# Altium schematic sheet Main_Sheet.SchDoc
size 420 x 297 mm; SheetNumber: 1; SheetTotal: 1
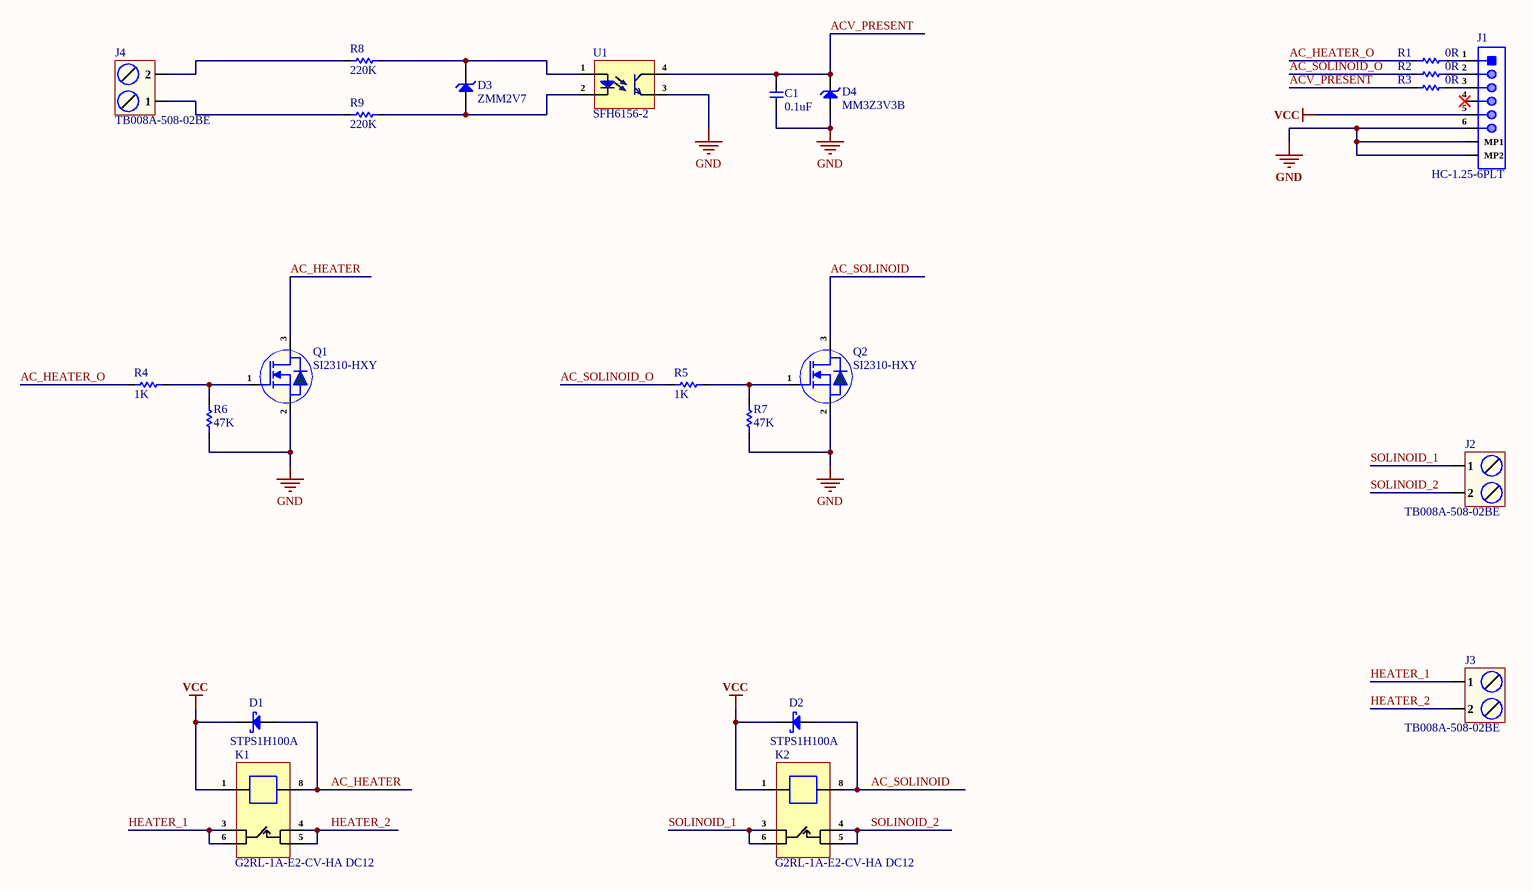
[diagram p0: Main_Sheet.SchDoc]

## Parts
C1  0.1uF  [Cap-0402]
D1  STPS1H100A  [SMA]
D2  STPS1H100A  [SMA]
D3  ZMM2V7  [LL-34]
D4  MM3Z3V3B  [SOD323F]
J1  HC-1.25-6PLT  [HC-1.25-6PLT]
J2  TB008A-508-02BE  [TB008A-508-02BE]
J3  TB008A-508-02BE  [TB008A-508-02BE]
J4  TB008A-508-02BE  [TB008A-508-02BE]
K1  G2RL-1A-E2-CV-HA DC12  [G2RL-1A-E2-CV-HA DC12]
K2  G2RL-1A-E2-CV-HA DC12  [G2RL-1A-E2-CV-HA DC12]
Q1  SI2310-HXY  [SOT-23]
Q2  SI2310-HXY  [SOT-23]
R1  0R  [Res-0603]
R2  0R  [Res-0603]
R3  0R  [Res-0603]
R4  1K  [Res-0402]
R5  1K  [Res-0402]
R6  47K  [Res-0402]
R7  47K  [Res-0402]
R8  220K  [Res-0603]
R9  220K  [Res-0603]
U1  SFH6156-2  [SFH6156-2]

## Nets
GND: C1.1 D4.1(A) J1.6 J1.MP1 J1.MP2 Q1.2(S) Q2.2(S) R6.1 R7.1 U1.3(E)
VCC: D1.1(K) D2.1(K) J1.5 K1.1 K2.1
AC_HEATER: D1.2(A) K1.8 Q1.3(D)
AC_HEATER_O: R1.1 R4.1
AC_SOLINOID: D2.2(A) K2.8 Q2.3(D)
AC_SOLINOID_O: R2.1 R5.1
ACV_PRESENT: C1.2 D4.2(K) R3.1 U1.4(C)
HEATER_1: J3.1 K1.3 K1.6
HEATER_2: J3.2 K1.4 K1.5
SOLINOID_1: J2.1 K2.3 K2.6
SOLINOID_2: J2.2 K2.4 K2.5
NetD3_1: D3.1(K) R8.2 U1.1(An)
NetD3_2: D3.2(A) R9.2 U1.2(Ca)
NetJ1_1: J1.1 R1.2
NetJ1_2: J1.2 R2.2
NetJ1_3: J1.3 R3.2
NetJ4_1: J4.1 R9.1
NetJ4_2: J4.2 R8.1
NetQ1_1: Q1.1(G) R4.2 R6.2
NetQ2_1: Q2.1(G) R5.2 R7.2

Not connected (* = marked no-connect by the designer): J1 4*

## Notes on the sheet
- File:
- Title:
- Date:
- Page
- Num:
- Total:
- Drawn By: Huzaifa Ali

## Library data of the parts
C1 = C1005X5R1H104K050BB: CAP CER 0.1UF 50V X5R 0402; Manufacturer: TDK; Capacitance: 100nF; Tolerance: 10%; Dielectric Material: Ceramic; Item Type: Capacitor; Supplier 1: Digi-Key; Manufacturer Part Number: C1005X5R1H104K050BB; Stock 1: 1455182; Pricing 1: 1=0.12, 10=0.09, 50=0.049, 100=0.04, 500=0.02858, 1000=0.02245, 2500=0.02041, 5000=0.01878 (USD); Mount: Surface Mount; Case/Package: 0402; Case Code (Metric): 1005; Case Code (Imperial): 0402; Min Operating Temperature: -55°C; Max Operating Temperature: 85°C; Dielectric: X5R; Voltage Rating: 50V; Package Quantity: 1; Packaging: Tape and Reel; Voltage Rating (DC): 50V; Termination: SMD/SMT; Length: 1mm; Height: 0.5mm; Width: 0.02inch; Thickness: 0.022inch; ComponentLink1URL: https://product.tdk.com/info/en/catalog/spec/mlccspec_commercial_general_midvoltage_en.pdf?src-supplier=Digi-Key; ComponentLink1Description: https://product.tdk.com/info/en/catalog/spec/mlccspec_commercial_general_midvoltage_en.pdf?src-supplier=Digi-Key; ComponentLink2URL: http://www.tdk.co.jp/tefe02/e413_c.pdf?src-supplier=Future+Electronics; ComponentLink2Description: http://www.tdk.co.jp/tefe02/e413_c.pdf?src-supplier=Future+Electronics; ComponentLink3URL: https://www.verical.com/server-webapp/html/getDatasheet?partID=743571&src-supplier=Verical; ComponentLink3Description: https://www.verical.com/server-webapp/html/getDatasheet?partID=743571&src-supplier=Verical; Supplier Part Number 1: 445-5942-1-ND; Weight: 2.3E-05oz; RoHS Compliant: Yes; Construction: Flat; Resistor Type: Ceramic; Voltage: 50V; Series: C; Depth: 0.5mm; Radiation Hardening: No; Lead Free: Lead Free; REACH SVHC: No SVHC; ComponentLink4URL: http://www.tdk.co.jp/tefe02/e412_c.pdf?src-supplier=Avnet+Europe; ComponentLink4Description: http://www.tdk.co.jp/tefe02/e412_c.pdf?src-supplier=Avnet+Europe; LCSC Part Number: C2181865
D1 D2 = STPS1H100A: DIODE SCHOTTKY 100V 1A SMA; Manufacturer: STMicroelectronics; Item Type: Diodes; Max Reverse Current: 4uA; Peak Non-Repetitive Surge Current: 50A; Forward Voltage: 860mV; Polarity: Standard; Supplier: Mouser; LCSC Part Number: C165701; Manufacturer Part Number: STPS1H100A; RoHS: Yes; Stock: 7367; Pricing: 1=0.34, 10=0.222, 50=0.222, 100=0.12, 1000=0.099, 10000=0.064 (USD); Mounting Technology: Surface Mount; Case/Package: SMA; Pins: 2; Min Operating Temperature: -65°C; Max Operating Temperature: 175°C; Max Repetitive Reverse Voltage (Vrrm): 100V; Forward Current: 1A; Packaging: Tape and Reel; Average Rectified Current: 1A; Series: -; Max Surge Current: 50A; Package Quantity: 5000; Max Reverse Leakage Current: 4uA; Max Forward Surge Current (Ifsm): 50A; Termination: SMD/SMT; Voltage Rating (DC): 100V; Output Current: 1A; Current Rating: 1A; Max Reverse Voltage (DC): 100V; Length: 4.6mm; Width: 2.95mm; Height: 2.03mm; Radiation Hardening: No; RoHS Compliant: Yes; Reach SVHC Compliant: No; Lead Free: Lead Free; ComponentLink1URL: https://datasheet.ciiva.com/14167/cd00001304-14167861.pdf?src-supplier=Distrelec; ComponentLink1Description: https://datasheet.ciiva.com/14167/cd00001304-14167861.pdf?src-supplier=Distrelec; ComponentLink2URL: https://datasheet.ciiva.com/915/cd00001304-915848.pdf?src-supplier=Digikey; ComponentLink2Description: https://datasheet.ciiva.com/915/cd00001304-915848.pdf?src-supplier=Digikey; ComponentLink3URL: https://datasheet.ciiva.com/7964/1690209-7964154.pdf?src-supplier=Element14; ComponentLink3Description: https://datasheet.ciiva.com/7964/1690209-7964154.pdf?src-supplier=Element14; ComponentLink4URL: https://datasheet.ciiva.com/915/cd00001304-915847.pdf?src-supplier=Digikey; ComponentLink4Description: https://datasheet.ciiva.com/915/cd00001304-915847.pdf?src-supplier=Digikey; ComponentLink5URL: https://datasheet.ciiva.com/915/cd00001304-915846.pdf?src-supplier=Digikey; ComponentLink5Description: https://datasheet.ciiva.com/915/cd00001304-915846.pdf?src-supplier=Digikey
D3 = ZMM2V7: Independent Type 2.5V~2.9V 500mW 2.7V LL-34 Zener Diodes ROHS; Manufacturer: HXY MOSFET; Item Type: Diode; Manufacturer Part Number: ZMM2V7; Package: LL-34; LCSC Part Number: C2891738; ComponentLink1Description: LCSC; ComponentLink1URL: https://www.lcsc.com/product-detail/Zener-Diodes_YONGYUTAI-ZMM2V7_C2891738.html
D4 = MM3Z3V3B: DIODE ZENER 3.3V 200MW SOD323F; Manufacturer: ON Semiconductor / Fairchild; Forward Voltage: 1V; Tolerance: 2%; Impedance: 89R; Max Reverse Leakage Current: 4.5uA; Test Current: 5mA; Element Configuration: Single; Supplier 1: Digi-Key; Manufacturer Part Number: MM3Z3V3B; Stock 1: 473644; Pricing 1: 1=0.22, 10=0.18, 100=0.0956, 500=0.06288, 1000=0.04276 (USD); Mount: Surface Mount; Number of Pins: 2; Weight: 0.0276g; Min Operating Temperature: -65°C; Max Operating Temperature: 150°C; Packaging: Tape and Reel; Package Quantity: 1; Max Power Dissipation: 200mW; Zener Voltage: 3.3V; Voltage Tolerance: 2%; Power Dissipation: 200mW; Working Voltage: 3.3V; Peak Reverse Current: 4.5uA; Length: 1.3mm; Height: 1mm; Width: 1.7mm; Radiation Hardening: No; REACH SVHC: No SVHC; Lead Free: Lead Free; ComponentLink1URL: http://www.onsemi.com/pub/Collateral/MM3Z9V1B-D.pdf?src-supplier=Digi-Key; ComponentLink1Description: http://www.onsemi.com/pub/Collateral/MM3Z9V1B-D.pdf?src-supplier=Digi-Key; ComponentLink2URL: http://www.mouser.com/ds/2/149/MM3Z3V3B-187166.pdf?src-supplier=Mouser; ComponentLink2Description: http://www.mouser.com/ds/2/149/MM3Z3V3B-187166.pdf?src-supplier=Mouser; ComponentLink3URL: https://www.fairchildsemi.com/datasheets/MM/MM3Z9V1B.pdf?src-supplier=Avnet; ComponentLink3Description: https://www.fairchildsemi.com/datasheets/MM/MM3Z9V1B.pdf?src-supplier=Avnet; ComponentLink4URL: http://www.farnell.com/datasheets/1706525.pdf?src-supplier=Element14; ComponentLink4Description: http://www.farnell.com/datasheets/1706525.pdf?src-supplier=Element14; Supplier Part Number 1: MM3Z3V3BCT-ND; LCSC Part Number: C2978865; Item Type: Diode
J1 = HC-1.25-6PLT: 1x6P 6P PicoBlade(MX 1.25) Tin 6 -25℃~+85℃ 2A 1 1.25mm Brass Surface Mount,Vertical SMD,P=1.25mm Wire To Board Connector ROHS; Manufacturer: HCTL; Manufacturer Part Number: HC-1.25-6PLT; Package: SMD,P=1.25mm; LCSC Part Number: C2845392; Item Type: Connector; ComponentLink1Description: LCSC; ComponentLink1URL: https://lcsc.com/product-detail/Wire-To-Board-Connector_HCTL-HC-1-25-6PLT_C2845392.html?s_z=n_HC-1.25-6PLT
J2-J4 = TB008A-508-02BE: TERMINAL BLOCK, SCREW TYPE, 5.08; Manufacturer: Same Sky; Item Type: Terminal Blocks; Approvals: CE, IEC, UL, cUL; Current Rating: 16A; Number of Contacts: 2; Number of Levels: 1; Pitch: 5.08mm; Voltage Rating: 300V; Wire/Cable Gauge: 12AWG; Supplier: DigiKey; Supplier Part Number: 102-6213-ND; Manufacturer Part Number: TB008A-508-02BE; RoHS: Compliant; Stock: 2734; Pricing: 1=0.61, 10=0.451, 25=0.3932, 50=0.3542, 100=0.3198, 250=0.282, 500=0.25896, 1200=0.23595, 6000=0.20759 (USD); Color: Blue; Height: 15.82mm; Lifecycle Status: Production; Max Operating Temperature: 105°C; Min Operating Temperature: -40°C; Mounting Technology: Screw; Number of Rows: 1; Width: 13.89mm; ComponentLink1URL: https://datasheet.octopart.com:443/TB008A-508-02BE-Same-Sky-datasheet-181920260.pdf?src-supplier=Same+Sky; ComponentLink1Description: https://datasheet.octopart.com:443/TB008A-508-02BE-Same-Sky-datasheet-181920260.pdf?src-supplier=Same+Sky; ComponentLink2URL: https://datasheet.octopart.com:443/TB008A-508-02BE-CUI-Devices-datasheet-175928141.pdf?src-supplier=Same+Sky; ComponentLink2Description: https://datasheet.octopart.com:443/TB008A-508-02BE-CUI-Devices-datasheet-175928141.pdf?src-supplier=Same+Sky; ComponentLink3URL: https://datasheet.octopart.com:443/TB008A-508-02BE-CUI-Devices-datasheet-144794964.pdf?src-supplier=Same+Sky; ComponentLink3Description: https://datasheet.octopart.com:443/TB008A-508-02BE-CUI-Devices-datasheet-144794964.pdf?src-supplier=Same+Sky; ComponentLink4URL: https://datasheet.octopart.com:443/TB008A-508-02BE-CUI-Devices-datasheet-180438533.pdf?src-supplier=IHS; ComponentLink4Description: https://datasheet.octopart.com:443/TB008A-508-02BE-CUI-Devices-datasheet-180438533.pdf?src-supplier=IHS; ComponentLink5URL: https://datasheet.octopart.com:443/TB008A-508-02BE-Same-Sky-datasheet-182881448.pdf?src-supplier=Electro+Sonic; ComponentLink5Description: https://datasheet.octopart.com:443/TB008A-508-02BE-Same-Sky-datasheet-182881448.pdf?src-supplier=Electro+Sonic; ComponentLink6URL: https://datasheet.octopart.com:443/TB008A-508-02BE-CUI-Devices-datasheet-154730749.pdf?src-supplier=Electro+Sonic; ComponentLink6Description: https://datasheet.octopart.com:443/TB008A-508-02BE-CUI-Devices-datasheet-154730749.pdf?src-supplier=Electro+Sonic; ComponentLink7URL: https://datasheet.octopart.com:443/TB008A-508-02BE-CUI-Devices-datasheet-175927974.pdf?src-supplier=CUI+Devices+SCT; ComponentLink7Description: https://datasheet.octopart.com:443/TB008A-508-02BE-CUI-Devices-datasheet-175927974.pdf?src-supplier=CUI+Devices+SCT; ComponentLink8URL: https://datasheet.octopart.com:443/TB008A-508-02BE-CUI-Devices-datasheet-142371924.pdf?src-supplier=Future+Electronics; ComponentLink8Description: https://datasheet.octopart.com:443/TB008A-508-02BE-CUI-Devices-datasheet-142371924.pdf?src-supplier=Future+Electronics; ComponentLink9URL: https://datasheet.octopart.com:443/TB008A-508-02BE-Same-Sky-datasheet-182050257.pdf?src-supplier=Future+Electronics; ComponentLink9Description: https://datasheet.octopart.com:443/TB008A-508-02BE-Same-Sky-datasheet-182050257.pdf?src-supplier=Future+Electronics; ComponentLink10URL: https://datasheet.octopart.com:443/TB008A-508-02BE-CUI-Devices-datasheet-175928506.pdf?src-supplier=Future+Electronics; ComponentLink10Description: https://datasheet.octopart.com:443/TB008A-508-02BE-CUI-Devices-datasheet-175928506.pdf?src-supplier=Future+Electronics; ComponentLink11URL: https://datasheet.octopart.com:443/TB008A-508-02BE-CUI-Devices-datasheet-147843969.pdf?src-supplier=Future+Electronics; ComponentLink11Description: https://datasheet.octopart.com:443/TB008A-508-02BE-CUI-Devices-datasheet-147843969.pdf?src-supplier=Future+Electronics; ComponentLink12URL: https://octopart.com:443/opatz8j6/c1?t=70RcvCe5ZkRgGfEt3V6vu9Rs4fRjMXZXdN7o_jKjc1dIStjs0IdWQTWbo2m4XJFZN-ZP8jrAm8ZplrmsDRNZWu5vD1uRxoUEzG546i7xsfV2Hlacn1XvUR2XbUoQGro5ohP2MwvVjf8PoqdhdL5ostV4A3wznZJYIF3cjV4w5lqdbJSsZe_bWwCbg-0xN0VRUvfB1EMY8Vje3Eupa8s9ZFT71pkE5p7-eHFbrk2At8AAZTx0zaGgq3cGzzCo7b3plQZDv0g9EsQyQUqhBC4JyFJJTeTHRWNNhUkmN73PD8OCyLOPLnegennELhgJeyY7HD7r-bGsAjSnjBwQDgR4SNS6WopDa7PwSknd4UaR&src-supplier=Compliance+Statements; ComponentLink12Description: https://octopart.com:443/opatz8j6/c1?t=70RcvCe5ZkRgGfEt3V6vu9Rs4fRjMXZXdN7o_jKjc1dIStjs0IdWQTWbo2m4XJFZN-ZP8jrAm8ZplrmsDRNZWu5vD1uRxoUEzG546i7xsfV2Hlacn1XvUR2XbUoQGro5ohP2MwvVjf8PoqdhdL5ostV4A3wznZJYIF3cjV4w5lqdbJSsZe_bWwCbg-0xN0VRUvfB1EMY8Vje3Eupa8s9ZFT71pkE5p7-eHFbrk2At8AAZTx0zaGgq3cGzzCo7b3plQZDv0g9EsQyQUqhBC4JyFJJTeTHRWNNhUkmN73PD8OCyLOPLnegennELhgJeyY7HD7r-bGsAjSnjBwQDgR4SNS6WopDa7PwSknd4UaR&src-supplier=Compliance+Statements; ComponentLink13URL: https://octopart.com:443/opatz8j6/c1?t=Uo7J4IF8yNdenAOC46u8Tj87WKOsK2A7c2vs8Sa5WYpsHicIfMoXbTSbdSiyOVgpxAIJCnEdsRMUssp9co8EivZcQamcZCig1rv7D-Ug8PwU11654nZt9VBHHEO9J9O1TmTLkeOA50viz6XbUTUcFOxEIWFtOIpsQudSLNpXl0qwCRhM7cqCRnP2WYjdfnel41QgPMBd0OmGtB5n4xaHO6yfR0O84tGT4DFJu17jeSMsdcHZCnKlQJPS09wnjUoIgC30PVYN35xN_xndXGhnfduxGQWssTNdQ2Ew4lLPFXECETpUa_FU3_NIDCJhBmvudBKdEuF4t1En-YL9AhFUeE1LU0Iszw0AVyDT8Hn1nDsKYQ&src-supplier=Compliance+Statements; ComponentLink13Description: https://octopart.com:443/opatz8j6/c1?t=Uo7J4IF8yNdenAOC46u8Tj87WKOsK2A7c2vs8Sa5WYpsHicIfMoXbTSbdSiyOVgpxAIJCnEdsRMUssp9co8EivZcQamcZCig1rv7D-Ug8PwU11654nZt9VBHHEO9J9O1TmTLkeOA50viz6XbUTUcFOxEIWFtOIpsQudSLNpXl0qwCRhM7cqCRnP2WYjdfnel41QgPMBd0OmGtB5n4xaHO6yfR0O84tGT4DFJu17jeSMsdcHZCnKlQJPS09wnjUoIgC30PVYN35xN_xndXGhnfduxGQWssTNdQ2Ew4lLPFXECETpUa_FU3_NIDCJhBmvudBKdEuF4t1En-YL9AhFUeE1LU0Iszw0AVyDT8Hn1nDsKYQ&src-supplier=Compliance+Statements; ComponentLink14URL: https://octopart.com:443/opatz8j6/c1?t=QvKslLqyPFzau17NptgVLNRcuMhYIDBdCODdkHqrYmlyYaojLdNAUnoimpM8kJVdayLtCnbbKOALirt3kAy58b19LXjk0_7F41XvMIDT0eRXxnt9UHZUhX802G-ZzTsQIZnaFSbz4MEhjhtI2qswXHCzfmb8sqF0HXUhYlN6-rqlzfA-OyFj0jZaaAfm4-lvU9uPpsocCV1oKDEwT57xEscWeOARtAbVwqthJApLrBmKsw-5DWDhVMlxDbVvBXDO0fpzQdRNXWzvV5iRUvpPqWvudAW3YO1yLdtS--LwTFp95_TZ35xs_jHFthiTFDMmHALKuZGPmqbJgedvZH3Zk3g47VKlaCUtWvKEaHE3&src-supplier=Compliance+Statements; ComponentLink14Description: https://octopart.com:443/opatz8j6/c1?t=QvKslLqyPFzau17NptgVLNRcuMhYIDBdCODdkHqrYmlyYaojLdNAUnoimpM8kJVdayLtCnbbKOALirt3kAy58b19LXjk0_7F41XvMIDT0eRXxnt9UHZUhX802G-ZzTsQIZnaFSbz4MEhjhtI2qswXHCzfmb8sqF0HXUhYlN6-rqlzfA-OyFj0jZaaAfm4-lvU9uPpsocCV1oKDEwT57xEscWeOARtAbVwqthJApLrBmKsw-5DWDhVMlxDbVvBXDO0fpzQdRNXWzvV5iRUvpPqWvudAW3YO1yLdtS--LwTFp95_TZ35xs_jHFthiTFDMmHALKuZGPmqbJgedvZH3Zk3g47VKlaCUtWvKEaHE3&src-supplier=Compliance+Statements; ComponentLink15URL: https://octopart.com:443/opatz8j6/c1?t=vaYY41CogfnopSfDOPxoaqGeCdGNbbMVVihVh9piZThYC4z5UdzLQjuTDbTJQBTosCtHjK1U8s3WuliWmK31H20qTGz1dkr0vY7KPWk-lwdRYh6T0AVJBxjWCi0eVjFp9VnnwA-vZFto2L6_FJ-1JJOZC7c21m4C6LgLcEGoiZY5ivV0bdaUH14NZNWQcfXhucKYp6KsuPDjo6IvsvVydEIyl4r3dmRXALVohKm2RtfKZd3dTcnpmcifjmEzWhR-u4uu0vOGtKFb8OyaUtZ3gXgC8hliX2ctByKhLk-vsmWP8rGswQgdKk_F7i01fLK7QHLl5nXUFhOop_anT0dafluEmPu9S4IjVmRqgao-gzkWkw&src-supplier=Compliance+Statements; ComponentLink15Description: https://octopart.com:443/opatz8j6/c1?t=vaYY41CogfnopSfDOPxoaqGeCdGNbbMVVihVh9piZThYC4z5UdzLQjuTDbTJQBTosCtHjK1U8s3WuliWmK31H20qTGz1dkr0vY7KPWk-lwdRYh6T0AVJBxjWCi0eVjFp9VnnwA-vZFto2L6_FJ-1JJOZC7c21m4C6LgLcEGoiZY5ivV0bdaUH14NZNWQcfXhucKYp6KsuPDjo6IvsvVydEIyl4r3dmRXALVohKm2RtfKZd3dTcnpmcifjmEzWhR-u4uu0vOGtKFb8OyaUtZ3gXgC8hliX2ctByKhLk-vsmWP8rGswQgdKk_F7i01fLK7QHLl5nXUFhOop_anT0dafluEmPu9S4IjVmRqgao-gzkWkw&src-supplier=Compliance+Statements
K1 K2 = G2RL-1A-E2-CV-HA DC12: RELAY GEN PURPOSE SPST 23A 12V; Coil Resistance: 360R; Contact Resistance: 100mR; Item Type: RELAY; ComponentLink1Description: LCSC; Supplier: Digi-Key; Supplier Part Number: Z13015-ND; RoHS: No; Category: Power Relays; Stock: 2658; Pricing: 1=4.97, 10=4.657, 25=4.14, 40=3.933, 80=3.726, 230=3.312, 500=3.105, 1000=2.89799 (USD); ComponentLink2URL: https://media.digikey.com/pdf/Data%20Sheets/Omron%20PDFs/G2RL-1A-E2-CV-HA%20DC5.pdf?src-supplier=Digi-Key; ComponentLink2Description: https://media.digikey.com/pdf/Data%20Sheets/Omron%20PDFs/G2RL-1A-E2-CV-HA%20DC5.pdf?src-supplier=Digi-Key; ComponentLink3URL: https://datasheet.octopart.com/G2RL-1A-E2-CV-HA-DC12-Omron-datasheet-27910337.pdf?src-supplier=TME; ComponentLink3Description: https://datasheet.octopart.com/G2RL-1A-E2-CV-HA-DC12-Omron-datasheet-27910337.pdf?src-supplier=TME
Q1 Q2 = SI2310-HXY: 60V 3A 1.7W 86mΩ@10V,3A N Channel SOT-23(TO-236) MOSFETs ROHS; Manufacturer: HXY; Item Type: Mosfet; Manufacturer Part Number: SI2310-HXY; Package: SOT-23(TO-236); LCSC Part Number: C4748716; ComponentLink1Description: LCSC; ComponentLink1URL: https://www.lcsc.com/product-detail/MOSFETs_span-style-background-color-ff0-HXY-span-MOSFET-SI2310-HXY_C4748716.html
R1-R3 = RC0603JR-070RL: RES 0 OHM JUMPER 1/10W 0603; Manufacturer: Yageo; Resistance: 0mR; Tolerance: 1%; Power Rating: 100mW; Voltage Rating (DC): 50V; Temperature Coefficient: 200ppm/°C; Resistance Tolerance: 5%; Item Type: Resistor; Supplier 1: Digi-Key; Manufacturer Part Number: RC0603JR-070RL; RoHS: Yes; Category: Chip SMD Resistors; Stock 1: 18081776; Pricing 1: 1=0.10000, 10=0.01700, 25=0.01240, 50=0.00960, 100=0.00700, 250=0.00536, 500=0.00430, 1000=0.00316 (USD); Case/Package: 0603; Number of Pins: 2; Contact Plating: Tin,Matte; Case Code (Imperial): 0603; Case Code (Metric): 1608; Size Code: 0603; Min Operating Temperature: -55°C; Max Operating Temperature: 155°C; Resistor Type: Thick Film; Packaging: Tape and Reel; Termination: SMD/SMT; Series: RC; Technology: THICK FILM; Package Quantity: 5000; Voltage Rating: 50V; Features: Moisture Resistant; Max Power Dissipation: 100mW; Number of Terminations: 2; Construction: Rectangular; Length: 1.6mm; Width: 0.8mm; Height: 0.45mm; Depth: 0.8mm; Radiation Hardening: No; Reach SVHC Compliant: No SVHC; Lead Free: Lead Free; RoHS Compliant: Yes; Military Standard: Not; Supplier Part Number 1: 311-0.0GRCT-ND; LCSC Part Number: C95177
R4 R5 = RC0402JR-071KL: RES 1K OHM 5% 1/16W 0402; Manufacturer: Yageo; Resistance: 1kR; Power Rating: 62.5mW; Voltage Rating: 50V; Temperature Coefficient: 100ppm/°C; Max Power Dissipation: 63mW; Item Type: Resistor; Supplier 1: Digi-Key; Manufacturer Part Number: RC0402JR-071KL; RoHS: Yes; Category: Chip SMD Resistors; Stock 1: 452315; Pricing 1: 1=0.10000, 10=0.01300, 100=0.00540, 1000=0.00244, 2500=0.00212, 5000=0.00175 (USD); Case/Package: 0402; Case Code (Imperial): 0402; Case Code (Metric): 1005; Size Code: 0402; Min Operating Temperature: -55°C; Max Operating Temperature: 155°C; Tolerance: 5%; Packaging: Tape and Reel; Package Quantity: 1; Termination: SMD/SMT; Resistor Type: Thick Film; Number of Terminations: 2; Features: Moisture Resistant; Series: RC; Resistance Tolerance: 5%; Construction: Rectangular; Length: 0.039inch; Width: 0.02inch; Height: 0.016inch; Depth: 0.5mm; REACH SVHC: No SVHC; Military Standard: Not; Lead Free: Lead Free; RoHS Compliant: Yes; ComponentLink1URL: https://datasheet.ciiva.com/7983/1018594-7983558.pdf?src-supplier=Element14; ComponentLink1Description: https://datasheet.ciiva.com/7983/1018594-7983558.pdf?src-supplier=Element14; ComponentLink2URL: https://datasheet.ciiva.com/2452/pyu-r-int-thick-7-2452756.pdf?src-supplier=Digi-Key; ComponentLink2Description: https://datasheet.ciiva.com/2452/pyu-r-int-thick-7-2452756.pdf?src-supplier=Digi-Key; ComponentLink3URL: https://datasheet.ciiva.com/2452/pyu-r-int-thick-7-2452757.pdf?src-supplier=Digi-Key; ComponentLink3Description: https://datasheet.ciiva.com/2452/pyu-r-int-thick-7-2452757.pdf?src-supplier=Digi-Key; ComponentLink4URL: https://datasheet.ciiva.com/2452/pyu-r-int-thick-7-2452755.pdf?src-supplier=Digi-Key; ComponentLink4Description: https://datasheet.ciiva.com/2452/pyu-r-int-thick-7-2452755.pdf?src-supplier=Digi-Key; ComponentLink5URL: https://datasheet.ciiva.com/7850/1018594-7850170.pdf?src-supplier=Element14; ComponentLink5Description: https://datasheet.ciiva.com/7850/1018594-7850170.pdf?src-supplier=Element14; ComponentLink6URL: https://datasheet.ciiva.com/7850/1018594-7850171.pdf?src-supplier=Element14; ComponentLink6Description: https://datasheet.ciiva.com/7850/1018594-7850171.pdf?src-supplier=Element14; ComponentLink7URL: https://datasheet.ciiva.com/17081/pyu-rc0402-51-rohs-l-6-r-17081438.pdf?src-supplier=Future+Electronics; ComponentLink7Description: https://datasheet.ciiva.com/17081/pyu-rc0402-51-rohs-l-6-r-17081438.pdf?src-supplier=Future+Electronics; Supplier Part Number 1: 311-1.0KJRCT-ND; LCSC Part Number: C105637
R6 R7 = RT0402BRE0747KL: RES SMD 47K OHM 0.1% 1/16W 0402; Manufacturer: Yageo; Power Rating: 62.5mW; Voltage Rating (DC): 50V; Value: 47kR; Max Power Dissipation: 63mW; Temperature Coefficient: 50ppm/°C; Item Type: Resistor; Supplier: Digikey; Supplier Part Number: YAG4391CT-ND; Manufacturer Part Number: RT0402BRE0747KL; RoHS: Yes; Category: Chip SMD Resistors; Stock: 11654; Pricing: 1=0.16, 10=0.121, 50=0.0958, 100=0.0858, 500=0.06536, 1000=0.05776, 5000=0.0428 (USD); Case/Package: 0402; Case Code (Metric): 3668CaseCodeMetric; Min Operating Temperature: -55°C; Max Operating Temperature: 155°C; Tolerance: 0.1%; Series: RT; Number of Terminations: 2; Voltage Rating: 50V; Length: 1mm; Width: 500um; Height: 350um; Lead Free: Lead Free; RoHS Compliant: Yes; ComponentLink1URL: https://datasheet.octopart.com/RT0402BRE0747KL-Yageo-datasheet-169971040.pdf?src-supplier=Future+Electronics; ComponentLink1Description: https://datasheet.octopart.com/RT0402BRE0747KL-Yageo-datasheet-169971040.pdf?src-supplier=Future+Electronics; ComponentLink2URL: http://www.yageo.com/documents/recent/PYu-RT_1-to-0.01_RoHS_L_9.pdf?src-supplier=Digikey; ComponentLink2Description: http://www.yageo.com/documents/recent/PYu-RT_1-to-0.01_RoHS_L_9.pdf?src-supplier=Digikey; ComponentLink3URL: https://www.yageo.com/upload/media/product/productsearch/datasheet/rchip/PYu-RT_1-to-0.01_RoHS_L_12.pdf?src-supplier=Digikey; ComponentLink3Description: https://www.yageo.com/upload/media/product/productsearch/datasheet/rchip/PYu-RT_1-to-0.01_RoHS_L_12.pdf?src-supplier=Digikey; LCSC Part Number: C853293
R8 R9 = RC0603FR-07220KL: RES 220K OHM 1% 1/10W 0603; Manufacturer: Yageo; Power Rating: 100mW; Resistance: 220kR; Voltage Rating: 50V; Temperature Coefficient: 100ppm/°C; Item Type: Resistor; Supplier 1: Arrow Electronics; Manufacturer Part Number: RC0603FR-07220KL; RoHS: Yes; Category: Chip SMD Resistors; Stock 1: 1565000; Pricing 1: 5000=0.00240 (USD); Case/Package: 0603; Number of Pins: 2; Case Code (Metric): 1608; Case Code (Imperial): 0603; Size Code: 0603; Min Operating Temperature: -55°C; Max Operating Temperature: 155°C; Tolerance: 1%; Packaging: Tape and Reel; Voltage Rating (DC): 50V; Package Quantity: 1; Resistor Type: Thick Film; Number of Terminations: 2; Termination: SMD/SMT; Max Power Dissipation: 100mW; Features: Moisture Resistant; Series: RC; Technology: THICK FILM; Resistance Tolerance: 1%; Length: 0.063inch; Width: 0.031inch; Height: 0.022inch; Depth: 0.8mm; RoHS Compliant: Yes; Reach SVHC Compliant: Yes; Lead Free: Lead Free; ComponentLink1URL: https://datasheet.ciiva.com/11808/0900766b80f96399-11808161.pdf?src-supplier=RSComponents; ComponentLink1Description: https://datasheet.ciiva.com/11808/0900766b80f96399-11808161.pdf?src-supplier=RSComponents; ComponentLink2URL: https://datasheet.ciiva.com/46412/443971-46412845.pdf?src-supplier=Element14; ComponentLink2Description: https://datasheet.ciiva.com/46412/443971-46412845.pdf?src-supplier=Element14; ComponentLink3URL: https://datasheet.ciiva.com/2453/pyu-r-int-thick-7-2453965.pdf?src-supplier=Digi-Key; ComponentLink3Description: https://datasheet.ciiva.com/2453/pyu-r-int-thick-7-2453965.pdf?src-supplier=Digi-Key; ComponentLink4URL: https://datasheet.ciiva.com/2453/pyu-r-int-thick-7-2453966.pdf?src-supplier=Digi-Key; ComponentLink4Description: https://datasheet.ciiva.com/2453/pyu-r-int-thick-7-2453966.pdf?src-supplier=Digi-Key; ComponentLink5URL: https://datasheet.ciiva.com/2453/pyu-r-int-thick-7-2453964.pdf?src-supplier=Digi-Key; ComponentLink5Description: https://datasheet.ciiva.com/2453/pyu-r-int-thick-7-2453964.pdf?src-supplier=Digi-Key; ComponentLink6URL: https://datasheet.ciiva.com/7746/443971-7746299.pdf?src-supplier=Element14; ComponentLink6Description: https://datasheet.ciiva.com/7746/443971-7746299.pdf?src-supplier=Element14; ComponentLink7URL: https://datasheet.ciiva.com/7746/443971-7746298.pdf?src-supplier=Element14; ComponentLink7Description: https://datasheet.ciiva.com/7746/443971-7746298.pdf?src-supplier=Element14; Supplier Part Number 1: RC0603FR-07220KL; LCSC Part Number: C123420
U1 = SFH6156-2: OPTOISOLATOR 5.3KV TRANS 4SMD; Manufacturer: Vishay; Item Type: IC; Supplier: Mouser; LCSC Part Number: C5156027; Manufacturer Part Number: SFH6156-2; RoHS: No; Stock: 11480; Pricing: 1=0.56, 10=0.37, 50=0.37, 100=0.253, 1000=0.218, 10000=0.217 (USD)